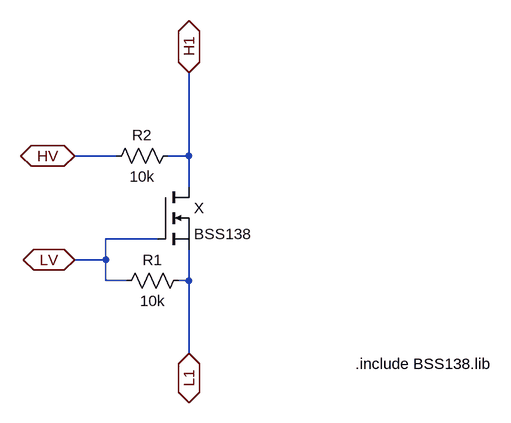
[diagram p0: schematic WWZMDiB_Level_Shifter_One_Port.asc]
WWZMDiB_Level_Shifter_One_Port.asc, the LTspice schematic file:
Version 4.1
SHEET 1 928 680
WIRE 112 32 48 32
WIRE 224 32 224 -96
WIRE 224 32 192 32
WIRE 224 80 224 32
WIRE 176 160 96 160
WIRE 96 192 96 160
WIRE 96 192 48 192
WIRE 96 224 96 192
WIRE 128 224 96 224
WIRE 224 224 224 176
WIRE 224 224 208 224
WIRE 224 336 224 224
FLAG 48 192 LV
IOPIN 48 192 BiDir
FLAG 48 32 HV
IOPIN 48 32 BiDir
FLAG 224 336 L1
IOPIN 224 336 BiDir
FLAG 224 -96 H1
IOPIN 224 -96 BiDir
SYMBOL res 224 208 R90
WINDOW 0 0 56 VBottom 2
WINDOW 3 32 56 VTop 2
SYMATTR InstName R1
SYMATTR Value 10k
SYMBOL res 208 16 R90
WINDOW 0 0 56 VBottom 2
WINDOW 3 32 56 VTop 2
SYMATTR InstName R2
SYMATTR Value 10k
SYMBOL nmos 176 80 R0
SYMATTR InstName X
SYMATTR Value BSS138
TEXT 480 352 Left 2 !.include BSS138.lib

The netlist it stands for:
* WWZMDiB_Level_Shifter_One_Port.asc
R1 L1 LV 10k
R2 H1 HV 10k
M§X H1 LV L1 L1 BSS138
.model NMOS NMOS
.model PMOS PMOS
.lib standard.mos
.include BSS138.lib
.backanno
.end